# Altium schematic sheet Hardwiring.SchDoc
size 594 x 420 mm; Address1: Address1; Address2: Address2; Address3: Address3; Address4: Address4; DocumentNumber: *Э3; SheetNumber: 10; SheetTotal: 11; DocumentType: Схема электрическая *
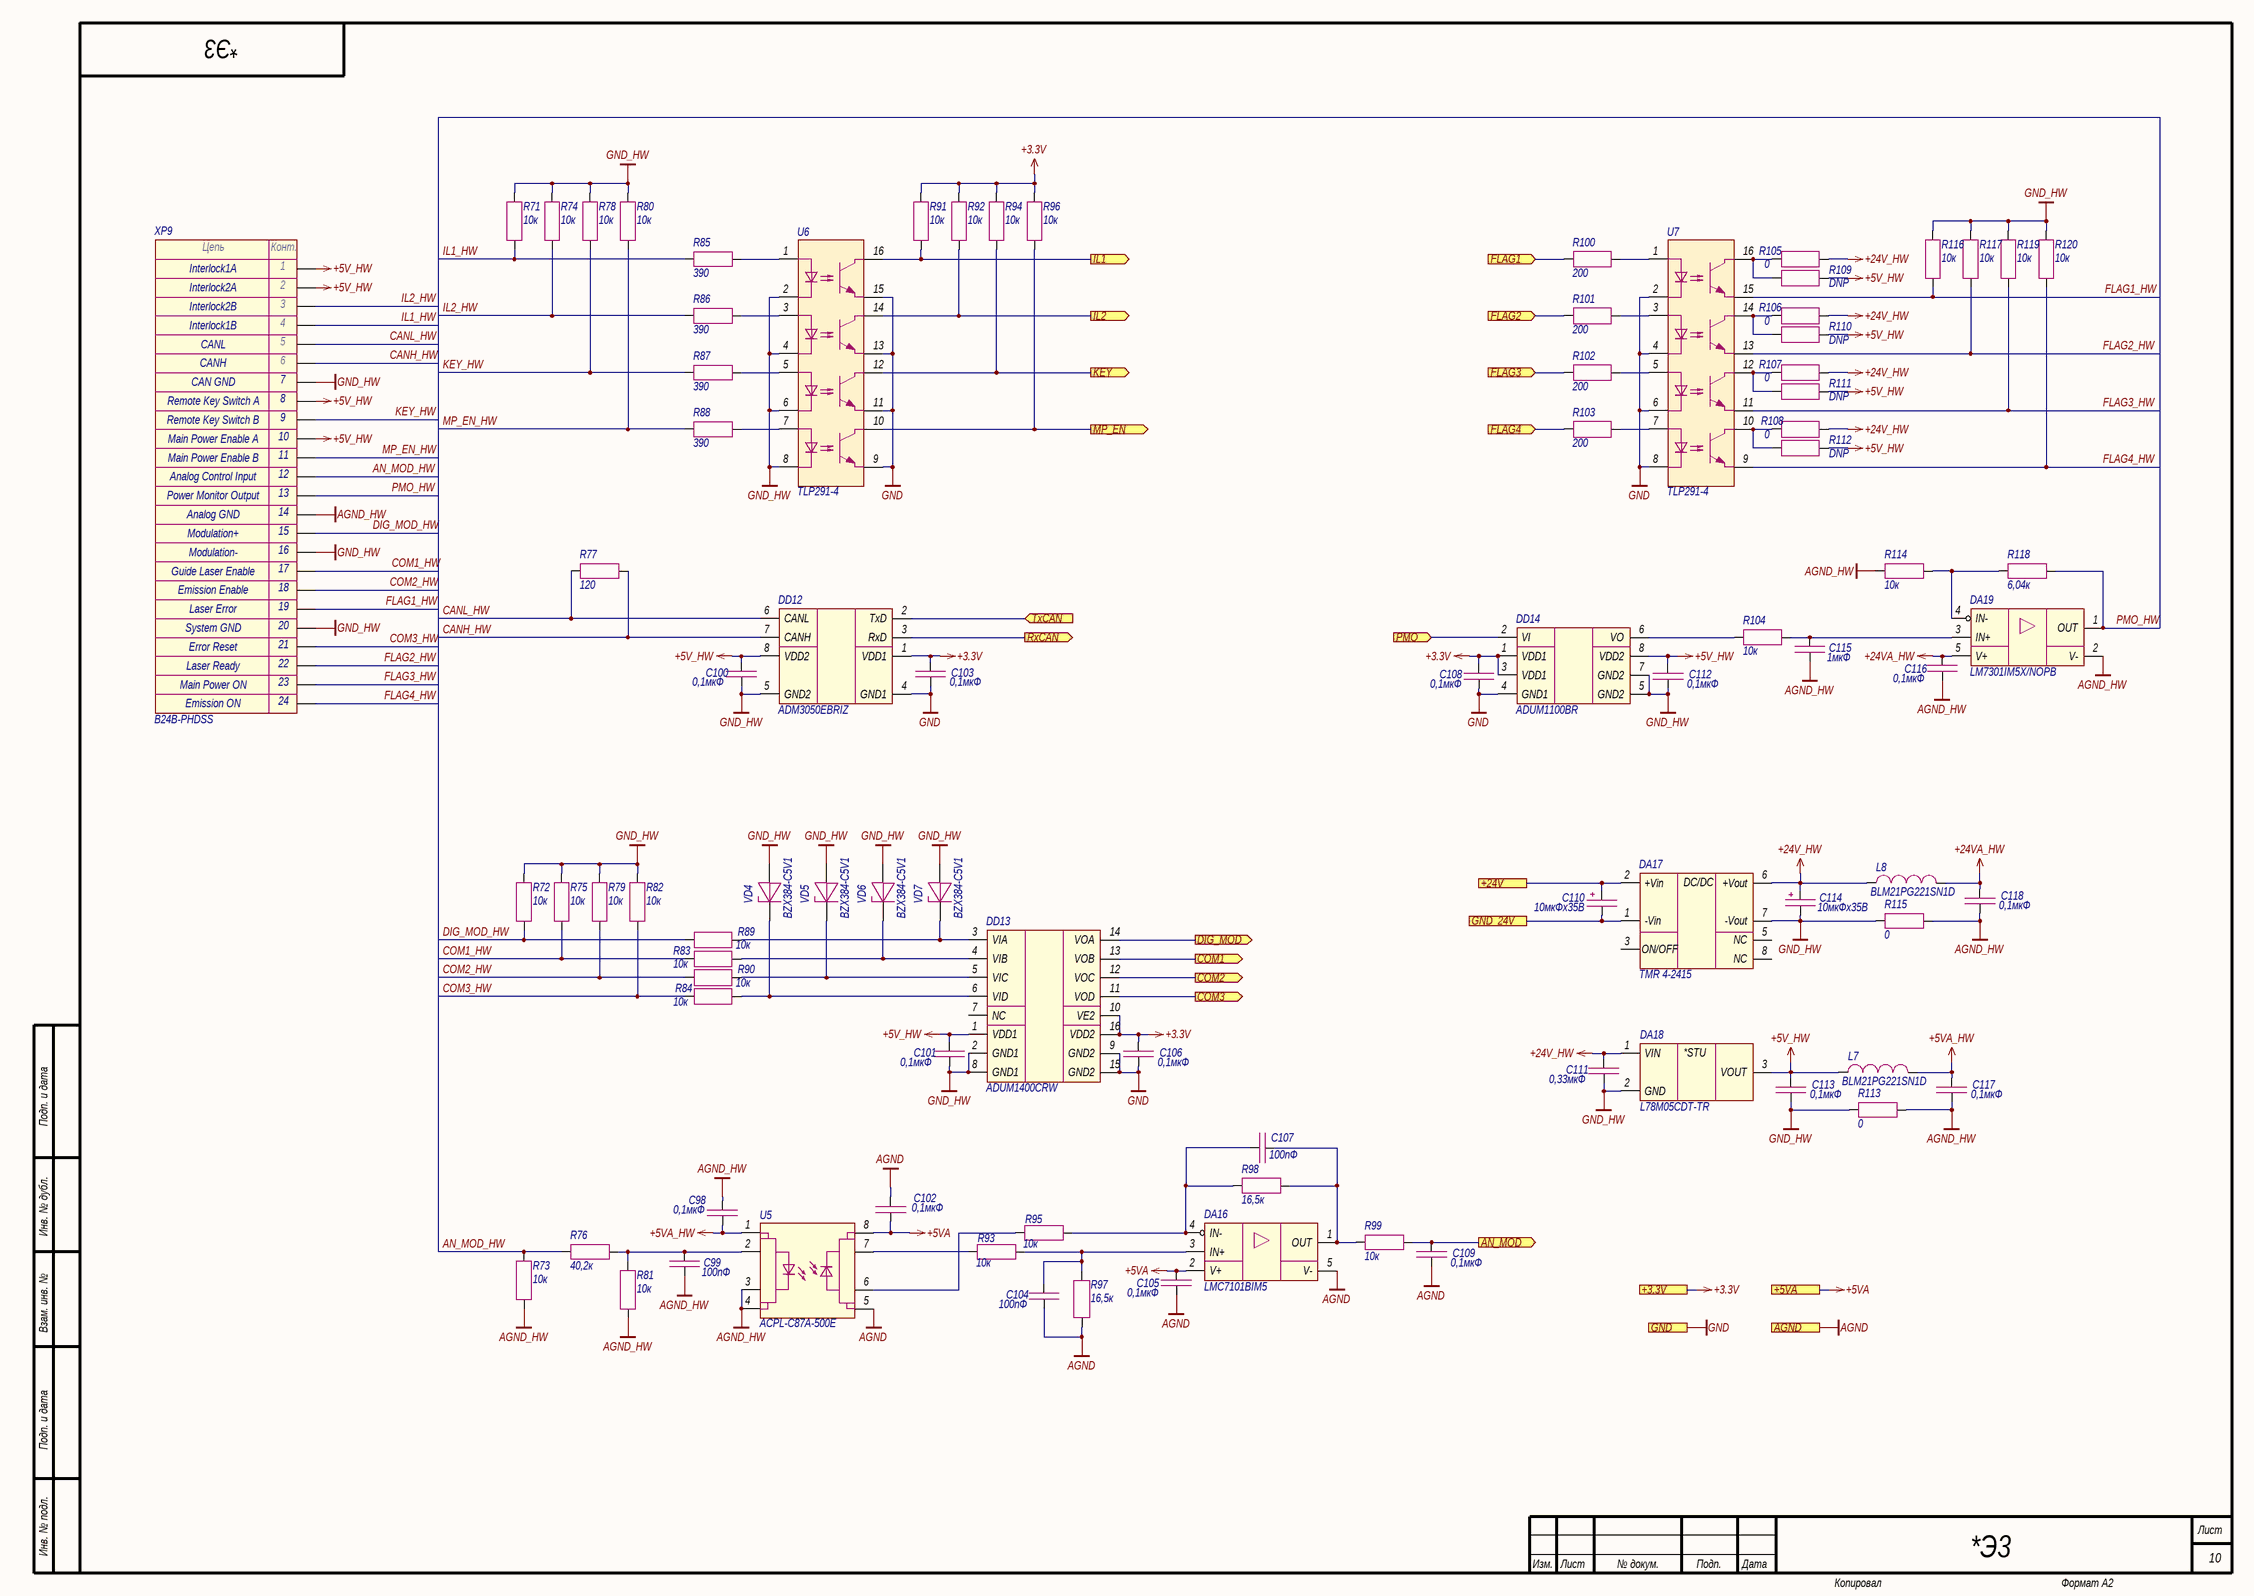
[diagram p0: Hardwiring.SchDoc]

## Parts
C98  0,1мкФ  [CAP_0603]
C99  100пФ  [CAP_0603]
C100  0,1мкФ  [CAP_0603]
C101  0,1мкФ  [CAP_0603]
C102  0,1мкФ  [CAP_0603]
C103  0,1мкФ  [CAP_0603]
C104  100пФ  [CAP_0603]
C105  0,1мкФ  [CAP_0603]
C106  0,1мкФ  [CAP_0603]
C107  100пФ  [CAP_0603]
C108  0,1мкФ  [CAP_0603]
C109  0,1мкФ  [CAP_0603]
C110  10мкФх35B  [CAP_C]
C111  0,33мкФ  [CAP_0805]
C112  0,1мкФ  [CAP_0603]
C113  0,1мкФ  [CAP_0603]
C114  10мкФх35B  [CAP_C]
C115  1мкФ  [CAP_0603]
C116  0,1мкФ  [CAP_0603]
C117  0,1мкФ  [CAP_0603]
C118  0,1мкФ  [CAP_0603]
DA16  LMC7101BIM5  [SOT-23-5]
DA17  TMR 4-2415  [TMR4 (SIP-8)]
DA18  L78M05CDT-TR  [TO-252]
DA19  LM7301IM5X/NOPB  [SOT-23-5]
DD12  ADM3050EBRIZ  [SOIC-8 RI-8-1]
DD13  ADUM1400CRW  [SOIC-16W]
DD14  ADUM1100BR  [SOIC-8]
L7  BLM21PG221SN1D  [IND_0805]
L8  BLM21PG221SN1D  [IND_0805]
R71  10к  [RES_0603]
R72  10к  [RES_0603]
R73  10к  [RES_0603]
R74  10к  [RES_0603]
R75  10к  [RES_0603]
R76  40,2к  [RES_0603]
R77  120  [RES_0603]
R78  10к  [RES_0603]
R79  10к  [RES_0603]
R80  10к  [RES_0603]
R81  10к  [RES_0603]
R82  10к  [RES_0603]
R83  10к  [RES_0603]
R84  10к  [RES_0603]
R85  390  [RES_0603]
R86  390  [RES_0603]
R87  390  [RES_0603]
R88  390  [RES_0603]
R89  10к  [RES_0603]
R90  10к  [RES_0603]
R91  10к  [RES_0603]
R92  10к  [RES_0603]
R93  10к  [RES_0603]
R94  10к  [RES_0603]
R95  10к  [RES_0603]
R96  10к  [RES_0603]
R97  16,5к  [RES_0603]
R98  16,5к  [RES_0603]
R99  10к  [RES_0603]
R100  200  [RES_0603]
R101  200  [RES_0603]
R102  200  [RES_0603]
R103  200  [RES_0603]
R104  10к  [RES_0603]
R105  0  [RES_0603]
R106  0  [RES_0603]
R107  0  [RES_0603]
R108  0  [RES_0603]
R109  DNP  [RES_0603]
R110  DNP  [RES_0603]
R111  DNP  [RES_0603]
R112  DNP  [RES_0603]
R113  0  [RES_0805]
R114  10к  [RES_0603]
R115  0  [RES_0805]
R116  10к  [RES_0603]
R117  10к  [RES_0603]
R118  6,04к  [RES_0603]
R119  10к  [RES_0603]
R120  10к  [RES_0603]
U5  ACPL-C87A-500E  [SSO-8]
U6  TLP291-4  [SOP-16]
U7  TLP291-4  [SOP-16]
VD4  BZX384-C5V1  [SOD-323]
VD5  BZX384-C5V1  [SOD-323]
VD6  BZX384-C5V1  [SOD-323]
VD7  BZX384-C5V1  [SOD-323]
XP9  B24B-PHDSS  [B24B-PHDSS]

## Ports
+3.3V (see Main[2B], Ethernet[3D], Fiber_interlock[2C], Flow_sensor[2C], LD_driver[1D], Power_supply[1D]), +5VA (see Main[2C], LD_driver[1D], Photodiode[1C]), +24V (see Main[2C], Flow_sensor[2C], Indication[1C], LD_driver[1D], Power_supply[1D]), AGND (see Main[2C], LD_driver[1D], Photodiode[1D], Thermistor[2C]), AN_MOD (out, see Main[2C]), COM1 (out, see Main[2B]), COM2 (out, see Main[2C]), COM3 (out, see Main[2C]), DIG_MOD (out, see Main[2B]), FLAG1 (in, see Main[2B]), FLAG2 (in, see Main[2B]), FLAG3 (in, see Main[2B]), FLAG4 (in, see Main[2B]), GND (see Main[2C], Ethernet[3D], Fiber_interlock[2C], Flow_sensor[2C], Guide_laser[1C], Indication[1C], LD_driver[1D], Power_supply[1D]), GND_24V (see Main[2C], Flow_sensor[2C], Indication[1C], LD_driver[1D], Power_supply[1D]), IL1 (out, see Main[2B]), IL2 (out, see Main[2B]), KEY (out, see Main[2B]), MP_EN (out, see Main[2B]), PMO (in, see Main[2B]), RxCAN (out, see Main[2C]), TxCAN (in, see Main[2C])

## Nets
+3.3V: C103.1 C106.1 C108.1 DD12.1(VDD1) DD13.10(VE2) DD13.16(VDD2) DD14.1(VDD1) DD14.3(VDD1) R91.1 R92.1 R94.1 R96.1 ; port +3.3V
+5V_HW: C100.1 C101.1 C112.1 C113.1 DA18.3(VOUT) DD12.8(VDD2) DD13.1(VDD1) DD14.8(VDD2) L7.1 R109.2 R110.2 R111.2 R112.2 XP9.1 XP9.2 XP9.8 XP9.10
+5VA: C102.1 C105.1 DA16.2(V+) U5.8(VDD2) ; port +5VA
+5VA_HW: C98.1 C117.1 L7.2 U5.1(VDD1)
+24V_HW: C111.2 C114.1 DA17.6(+Vout) DA18.1(VIN) L8.1 R105.2 R106.2 R107.2 R108.2
+24VA_HW: C116.1 C118.1 DA19.5(V+) L8.2
AGND: C102.2 C104.2 C105.2 C109.2 DA16.5(V-) R97.2 U5.5(GND2) ; port AGND
AGND_HW: C98.2 C99.1 C115.2 C116.2 C117.2 C118.2 DA19.2(V-) R73.2 R81.2 R113.2 R114.1 R115.2 U5.3(SHDN) U5.4(GND1) XP9.14
GND: C103.2 C106.2 C108.2 DD12.4(GND1) DD13.9(GND2) DD13.15(GND2) DD14.4(GND1) U6.9 U6.11 U6.13 U6.15 U7.2 U7.4 U7.6 U7.8 ; port GND
GND_HW: C100.2 C101.2 C111.1 C112.2 C113.2 C114.2 DA17.7(-Vout) DA18.2(GND) DD12.5(GND2) DD13.2(GND1) DD13.8(GND1) DD14.5(GND2) DD14.7(GND2) R71.1 R72.1 R74.1 R75.1 R78.1 R79.1 R80.1 R82.1 R113.1 R115.1 R116.1 R117.1 R119.1 R120.1 U6.2 U6.4 U6.6 U6.8 VD4.2(A) VD5.2(A) VD6.2(A) VD7.2(A) XP9.7 XP9.16 XP9.20
+24V: C110.1 DA17.2(+Vin) ; port +24V
AN_MOD: C109.1 R99.2 ; port AN_MOD
AN_MOD_HW: R73.1 R76.2 XP9.12
CANH_HW: DD12.7(CANH) R77.2 XP9.6
CANL_HW: DD12.6(CANL) R77.1 XP9.5
COM1: DD13.13(VOB) ; port COM1
COM1_HW: R75.2 R83.1 XP9.17
COM2: DD13.12(VOC) ; port COM2
COM2_HW: R79.2 R90.1 XP9.18
COM3: DD13.11(VOD) ; port COM3
COM3_HW: R82.2 R84.1 XP9.21
DIG_MOD: DD13.14(VOA) ; port DIG_MOD
DIG_MOD_HW: R72.2 R89.1 XP9.15
FLAG1: R100.2 ; port FLAG1
FLAG1_HW: R116.2 U7.15 XP9.19
FLAG2: R101.2 ; port FLAG2
FLAG2_HW: R117.2 U7.13 XP9.22
FLAG3: R102.2 ; port FLAG3
FLAG3_HW: R119.2 U7.11 XP9.23
FLAG4: R103.2 ; port FLAG4
FLAG4_HW: R120.2 U7.9 XP9.24
GND_24V: C110.2 DA17.1(-Vin) ; port GND_24V
IL1: R91.2 U6.16 ; port IL1
IL1_HW: R71.2 R85.1 XP9.4
IL2: R92.2 U6.14 ; port IL2
IL2_HW: R74.2 R86.1 XP9.3
KEY: R94.2 U6.12 ; port KEY
KEY_HW: R78.2 R87.1 XP9.9
MP_EN: R96.2 U6.10 ; port MP_EN
MP_EN_HW: R80.2 R88.1 XP9.11
PMO: DD14.2(VI) ; port PMO
PMO_HW: DA19.1(OUT) R118.2 XP9.13
RxCAN: DD12.3(RxD) ; port RxCAN
TxCAN: DD12.2(TxD) ; port TxCAN
NetC99_2: C99.2 R76.1 R81.1 U5.2(VIN)
NetC104_1: C104.1 DA16.3(IN+) R93.2 R97.1
NetC107_1: C107.1 DA16.4(IN-) R95.2 R98.2
NetC107_2: C107.2 DA16.1(OUT) R98.1 R99.1
NetC115_1: C115.1 DA19.3(IN+) R104.2
NetDA19_4: DA19.4(IN-) R114.2 R118.1
NetDD13_3: DD13.3(VIA) R89.2 VD7.1(K)
NetDD13_4: DD13.4(VIB) R83.2 VD6.1(K)
NetDD13_5: DD13.5(VIC) R90.2 VD5.1(K)
NetDD13_6: DD13.6(VID) R84.2 VD4.1(K)
NetDD14_6: DD14.6(VO) R104.1
NetR85_2: R85.2 U6.1
NetR86_2: R86.2 U6.3
NetR87_2: R87.2 U6.5
NetR88_2: R88.2 U6.7
NetR93_1: R93.1 U5.7(VOUT+)
NetR95_1: R95.1 U5.6(VOUT-)
NetR100_1: R100.1 U7.1
NetR101_1: R101.1 U7.3
NetR102_1: R102.1 U7.5
NetR103_1: R103.1 U7.7
NetR105_1: R105.1 R109.1 U7.16
NetR106_1: R106.1 R110.1 U7.14
NetR107_1: R107.1 R111.1 U7.12
NetR108_1: R108.1 R112.1 U7.10

Not connected (* = marked no-connect by the designer): DA17 3(ON/OFF) 5(NC) 8(NC); DD13 7(NC)

## Notes on the sheet
- Interlock1A
- Interlock2A
- Interlock2B
- Interlock1B
- CANL
- CANH
- (near XP9) Remote Key Switch A
- CAN GND
- (near XP9) Remote Key Switch B
- (near XP9) Main Power Enable A
- (near XP9) Main Power Enable B
- (near XP9) Analog Control Input
- (near XP9) Power Monitor Output
- Analog GND
- Modulation+
- Modulation-
- (near XP9) Guide Laser Enable
- (near XP9) Emission Enable
- System GND
- Error Reset
- Laser Error
- Main Power ON
- Emission ON
- Laser Ready
- Подп. и дата
- Инв. № дубл.
- Взам. инв. №
- Инв. № подл.
- Изм.
- Лист
- № докум.
- Подп.
- Дата
- Копировал
- Формат А2
- (in symbol Connector-24) Цепь; Конт.
- (in symbol L78M) *STU
- (in symbol TMR4) DC/DC

## Library data of the parts
C98 C100-C103 C105 C106 C108 C109 C112 C113 C116-C118 = Capacitor: Manufacturer: Murata; Model: GRM188R71H104KA93D; Value: 0,1мкФ; Document: *
C99 C104 C107 = Capacitor: Manufacturer: Murata; Model: GRM1885C1H101JA01D; Value: 100пФ; Document: *
C110 C114 = Capacitor_Polar: Model: TECAP, 10 мкФ, 35 В, тип C, 10%; Value: 10мкФх35B; Document: *; Manufacturer: *
C111 = Capacitor: Manufacturer: Murata; Model: GRM219R71H334KA88D; Value: 0,33мкФ; Document: *
C115 = Capacitor: Manufacturer: Murata; Model: GRM188R61H105KAALD; Value: 1мкФ; Document: *
DA16 = LMC7101: Manufacturer: Texas Instruments; Model: LMC7101BIM5; Document: *
DA17 = TMR4: Manufacturer: Traco Power; Model: TMR 4-2415; Document: *
DA18 = L78M: Manufacturer: STMicroelectronics; Model: L78M05CDT-TR; Document: *
DA19 = LM7301IM5: Manufacturer: Texas Instruments; Model: LM7301IM5X/NOPB; Document: *
DD12 = ADM3050EBRIZ: Manufacturer: Analog Devices; Model: ADM3050EBRIZ; Document: *
DD13 = ADUM1400: Manufacturer: Analog Devices; Model: ADUM1400CRW; Document: *
DD14 = ADUM1100: Manufacturer: Analog Devices; Model: ADUM1100BR; Document: *
L7 L8 = Inductor: Manufacturer: Murata; Value: *; Model: BLM21PG221SN1D; Document: *
R71-R75 R78-R84 R89-R96 R99 R104 R114 R116 R117 R119 R120 = Resistor: Manufacturer: Yageo; Model: RC0603FR-0710KL; Value: 10к; Document: *
R76 = Resistor: Manufacturer: Yageo; Model: RC0603FR-0740K2L; Value: 40,2к; Document: *
R77 = Resistor: Manufacturer: Yageo; Model: RC0603FR-07120RL; Value: 120; Document: *
R85-R88 = Resistor: Manufacturer: Yageo; Model: RC0603FR-07390RL; Value: 390; Document: *
R97 R98 = Resistor: Manufacturer: Yageo; Model: RC0603FR-0716K5L; Value: 16,5к; Document: *
R100-R103 = Resistor: Manufacturer: Yageo; Model: RC0603FR-07200RL; Value: 200; Document: *
R105-R108 = Resistor: Manufacturer: Yageo; Model: RC0603FR-070RL; Value: 0; Document: *
R109-R112 = Resistor: Value: DNP; Model: DNP; Document: *; Manufacturer: *
R113 R115 = Resistor: Manufacturer: Yageo; Model: RC0805FR-070RL; Value: 0; Document: *
R118 = Resistor: Manufacturer: Yageo; Model: RC0603FR-076K04L; Value: 6,04к; Document: *
U5 = ACPL-C87: Manufacturer: Broadcom; Model: ACPL-C87A-500E
U6 U7 = TLP281-4: Manufacturer: Toshiba; Model: TLP291-4; Document: *
VD4-VD7 = Diode_Zener: Manufacturer: Nexperia; Model: BZX384-C5V1; Document: *
XP9 = Connector-24: Manufacturer: JST; Model: B24B-PHDSS; Document: *